# Altium schematic sheet GSM_Sheet.SchDoc
size 420 x 297 mm
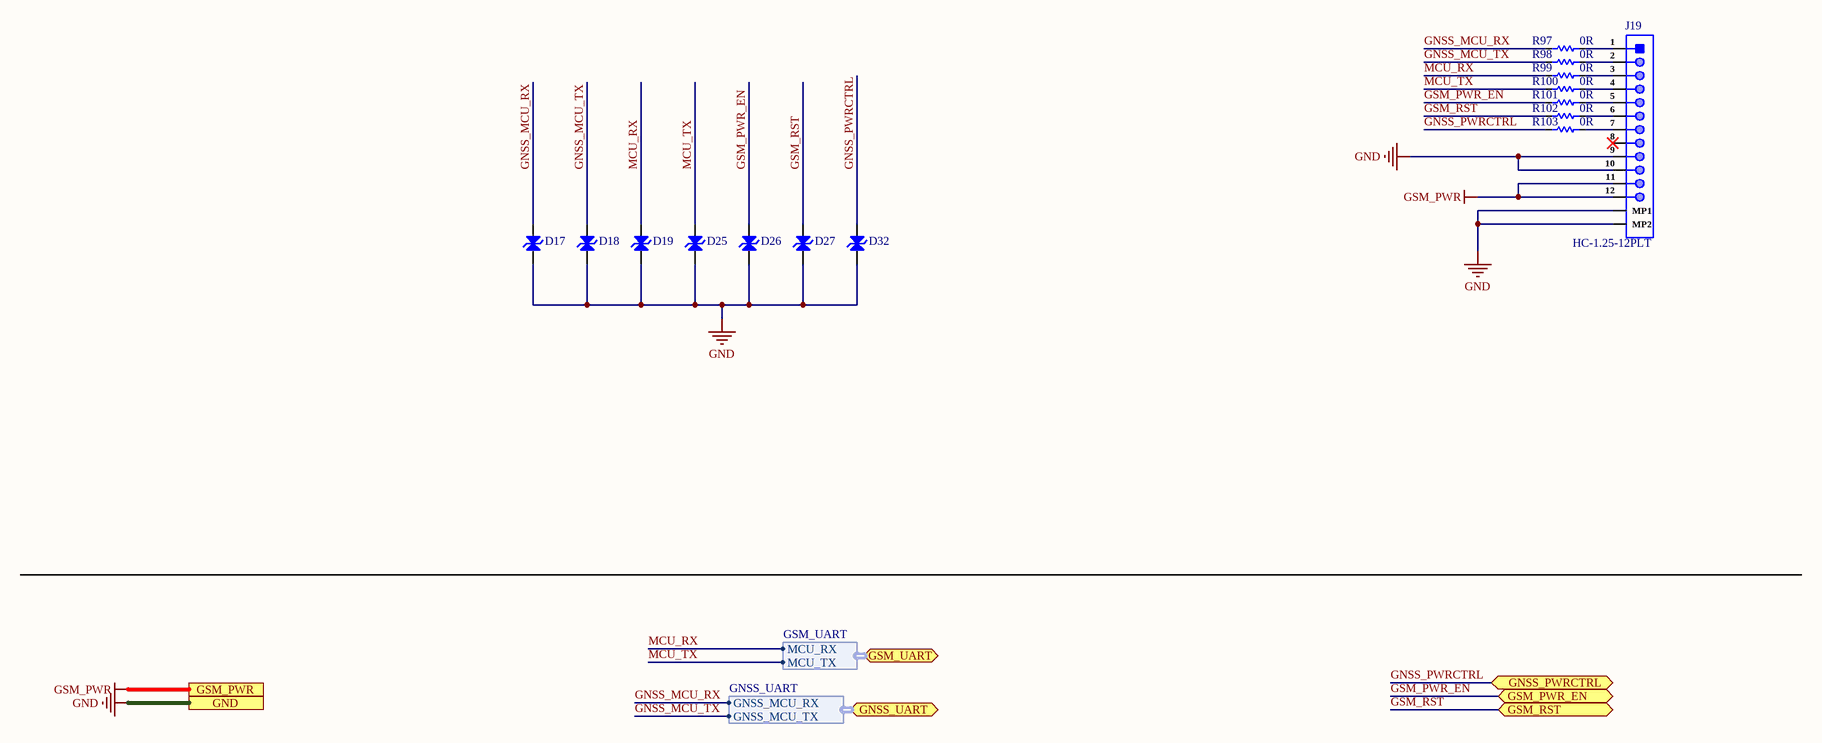
[diagram p0: GSM_Sheet.SchDoc]

## Parts
D17  LESD8D3.3CAT5G  [SOD-882 Bi Directional]  (value not drawn)
D18  LESD8D3.3CAT5G  [SOD-882 Bi Directional]  (value not drawn)
D19  LESD8D3.3CAT5G  [SOD-882 Bi Directional]  (value not drawn)
D25  LESD8D3.3CAT5G  [SOD-882 Bi Directional]  (value not drawn)
D26  LESD8D3.3CAT5G  [SOD-882 Bi Directional]  (value not drawn)
D27  LESD8D3.3CAT5G  [SOD-882 Bi Directional]  (value not drawn)
D32  LESD8D3.3CAT5G  [SOD-882 Bi Directional]  (value not drawn)
J19  HC-1.25-12PLT  [HC-1.25-12PLT]
R97  0R  [Res-0603]
R98  0R  [Res-0603]
R99  0R  [Res-0603]
R100  0R  [Res-0603]
R101  0R  [Res-0603]
R102  0R  [Res-0603]
R103  0R  [Res-0603]

## Ports
GND, GNSS_PWRCTRL (bidir), GNSS_UART (bidir, harness GNSS_UART), GSM_PWR, GSM_PWR_EN (bidir), GSM_RST (bidir), GSM_UART (bidir, harness GSM_UART)

## Harnesses
GSM_UART: MCU_RX, MCU_TX
GNSS_UART: GNSS_MCU_RX, GNSS_MCU_TX

## Nets
GND: D17.1(A) D18.1(A) D19.1(A) D25.1(A) D26.1(A) D27.1(A) D32.1(A) J19.9 J19.10 J19.MP1 J19.MP2 ; port GND
GSM_PWR: J19.11 J19.12 ; port GSM_PWR
GNSS_MCU_RX: D17.2(A) R97.1 ; port GNSS_UART.GNSS_MCU_RX
GNSS_MCU_TX: D18.2(A) R98.1 ; port GNSS_UART.GNSS_MCU_TX
GNSS_PWRCTRL: D32.2(A) R103.1 ; port GNSS_PWRCTRL
GSM_PWR_EN: D26.2(A) R101.1 ; port GSM_PWR_EN
GSM_RST: D27.2(A) R102.1 ; port GSM_RST
MCU_RX: D19.2(A) R99.1 ; port GSM_UART.MCU_RX
MCU_TX: D25.2(A) R100.1 ; port GSM_UART.MCU_TX
NetJ19_1: J19.1 R97.2
NetJ19_2: J19.2 R98.2
NetJ19_3: J19.3 R99.2
NetJ19_4: J19.4 R100.2
NetJ19_5: J19.5 R101.2
NetJ19_6: J19.6 R102.2
NetJ19_7: J19.7 R103.2

Not connected (* = marked no-connect by the designer): J19 8*

## Notes on the sheet
- File:
- Title:
- Date:
- Page
- Num:
- Total:
- Drawn By: Huzaifa Ali

## Library data of the parts
D17-D19 D25-D27 D32 = LESD8D3.3CAT5G: 5V 10V 3.3V Bi-Directional SOD-882 ESD Protection Devices ROHS; Manufacturer: LRC; Manufacturer Part Number: LESD8D3.3CAT5G; Package: SOD-882; LCSC Part Number: C172409; Item Type: Protection Device; ComponentLink1Description: LCSC; ComponentLink1URL: https://www.lcsc.com/product-detail/span-style-background-color-ff0-ESD-span-Protection-Devices_LRC-LESD8D3-3CAT5G_C172409.html
J19 = HC-1.25-12PLT: 1x12P 12P PicoBlade(MX 1.25) Tin 12 -25℃~+85℃ 2A 1 1.25mm Brass Surface Mount,Vertical SMD,P=1.25mm Wire To Board Connector ROHS; Manufacturer: HCTL; Manufacturer Part Number: HC-1.25-12PLT; Package: SMD,P=1.25mm; LCSC Part Number: C2937190; Item Type: Wire To Board Connector; ComponentLink1Description: LCSC; ComponentLink1URL: https://lcsc.com/product-detail/Wire-To-Board-Connector_HCTL-HC-1-25-12PLT_C2937190.html?s_z=n_1.25-12plt
R97-R103 = RC0603JR-070RL: RES 0 OHM JUMPER 1/10W 0603; Manufacturer: Yageo; Resistance: 0mR; Tolerance: 1%; Power Rating: 100mW; Voltage Rating (DC): 50V; Temperature Coefficient: 200ppm/°C; Resistance Tolerance: 5%; Item Type: Resistor; Supplier 1: Digi-Key; Manufacturer Part Number: RC0603JR-070RL; RoHS: Yes; Category: Chip SMD Resistors; Stock 1: 18081776; Pricing 1: 1=0.10000, 10=0.01700, 25=0.01240, 50=0.00960, 100=0.00700, 250=0.00536, 500=0.00430, 1000=0.00316 (USD); Case/Package: 0603; Number of Pins: 2; Contact Plating: Tin,Matte; Case Code (Imperial): 0603; Case Code (Metric): 1608; Size Code: 0603; Min Operating Temperature: -55°C; Max Operating Temperature: 155°C; Resistor Type: Thick Film; Packaging: Tape and Reel; Termination: SMD/SMT; Series: RC; Technology: THICK FILM; Package Quantity: 5000; Voltage Rating: 50V; Features: Moisture Resistant; Max Power Dissipation: 100mW; Number of Terminations: 2; Construction: Rectangular; Length: 1.6mm; Width: 0.8mm; Height: 0.45mm; Depth: 0.8mm; Radiation Hardening: No; Reach SVHC Compliant: No SVHC; Lead Free: Lead Free; RoHS Compliant: Yes; Military Standard: Not; Supplier Part Number 1: 311-0.0GRCT-ND; LCSC Part Number: C95177